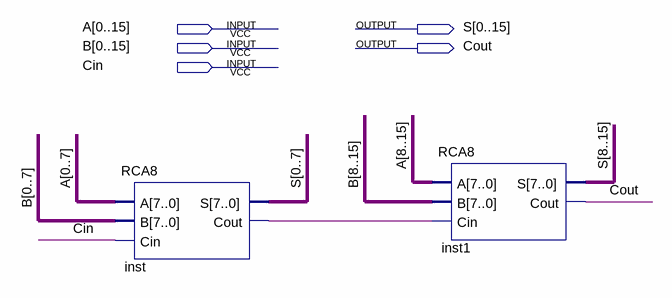
[diagram p0: schematic sheet]
// Quartus schematic RCA16.bdf as structural Verilog: 2 symbols, 5 pins
module RCA16 (
  input  [0:15] A,
  input  [0:15] B,
  input  Cin,
  output [0:15] S,
  output Cout
);

  wire inst_cout;

  RCA8 inst (.A(A[0:7]), .B(B[0:7]), .Cin(Cin), .S(S[0:7]), .Cout(inst_cout));
  RCA8 inst1 (.A(A[8:15]), .B(B[8:15]), .Cin(inst_cout), .S(S[8:15]), .Cout(Cout));
endmodule
